# EAGLE schematic ecad-receiver-v5-rx-rev-1 (EAGLE 9.7.0)
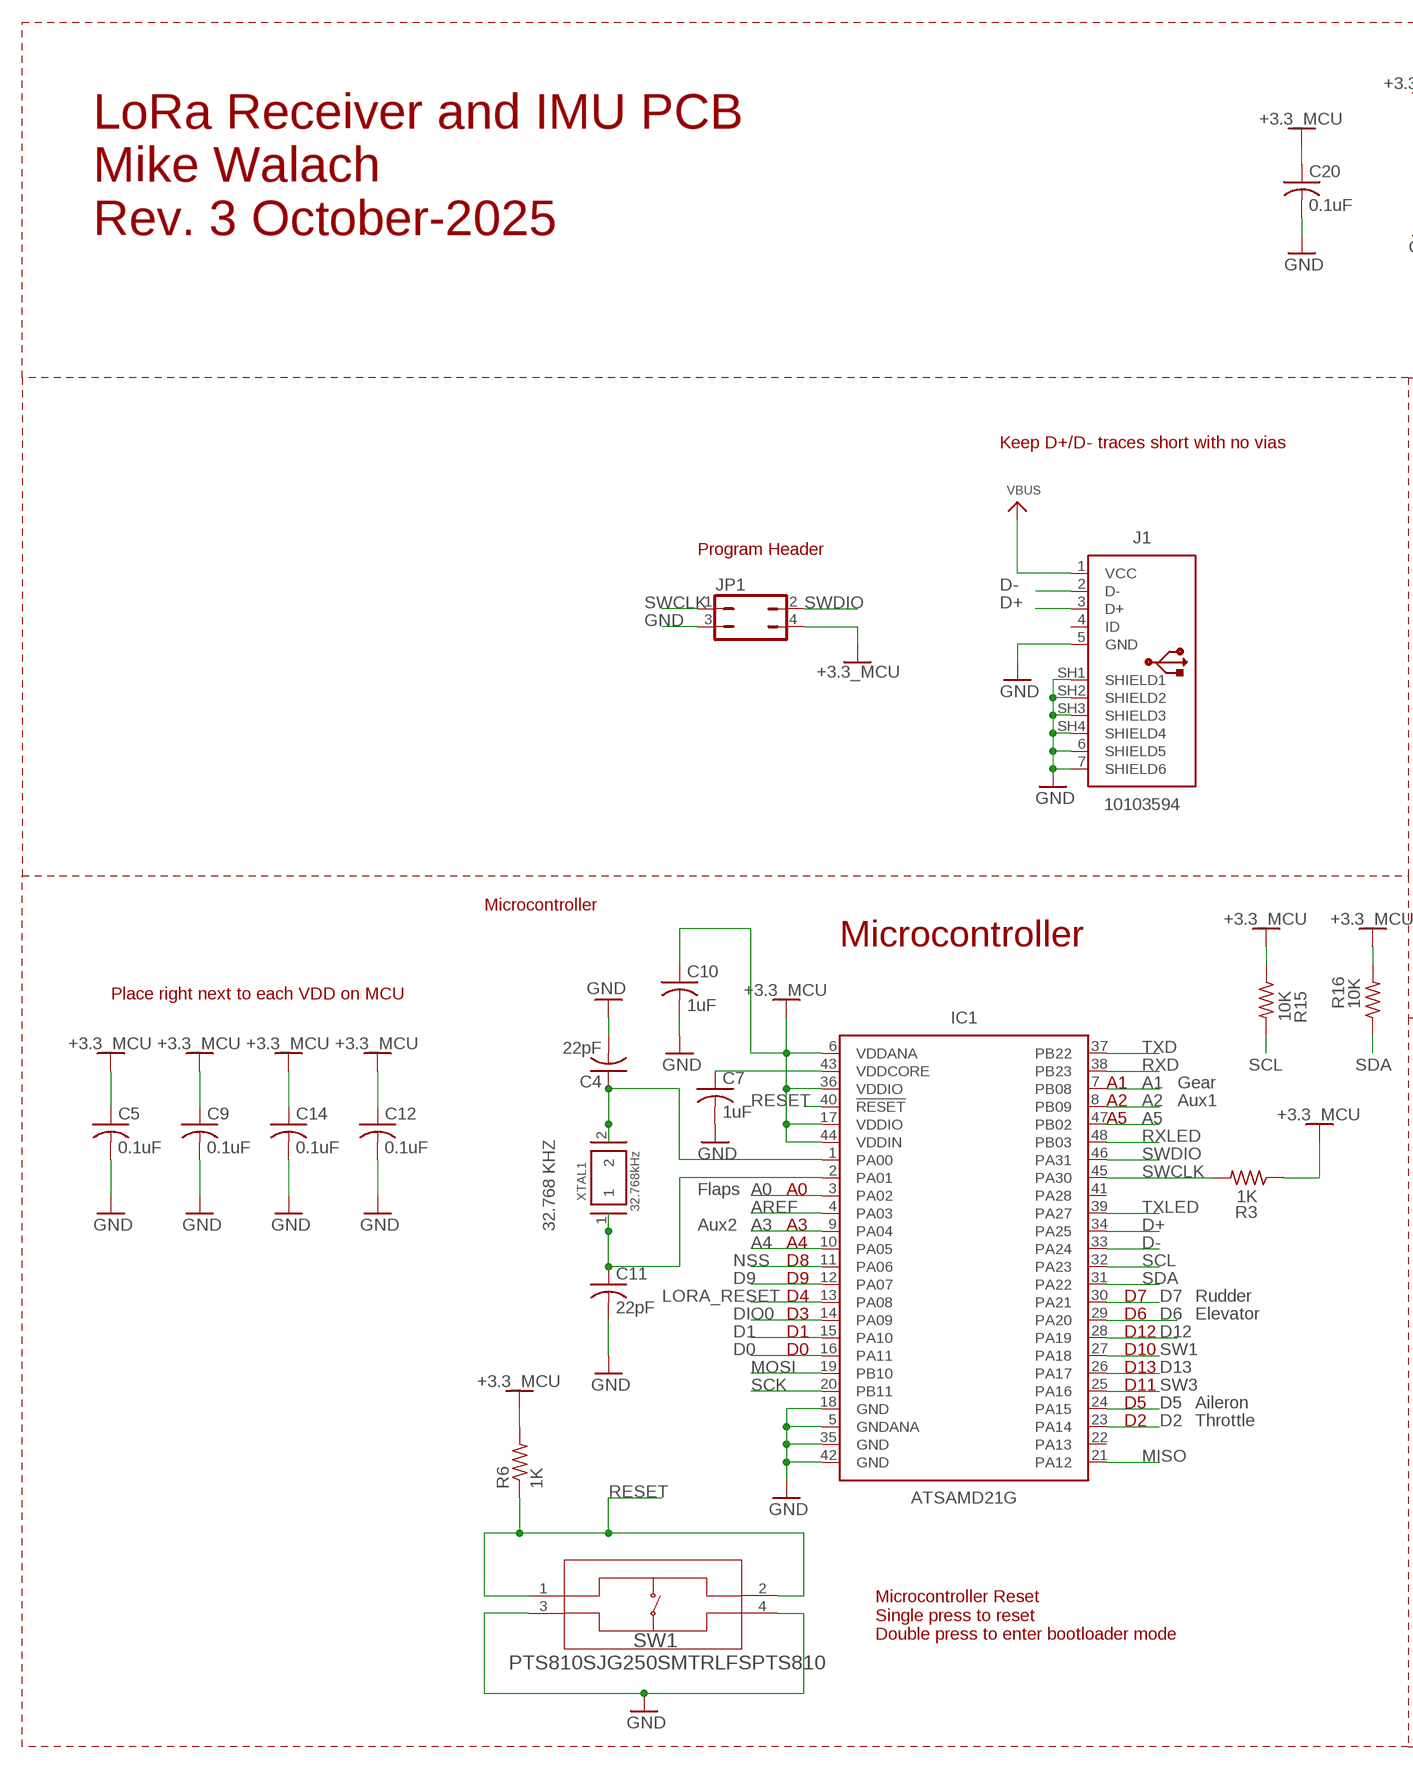
[diagram p0: schematic, sheet 1, part 1 of 2]
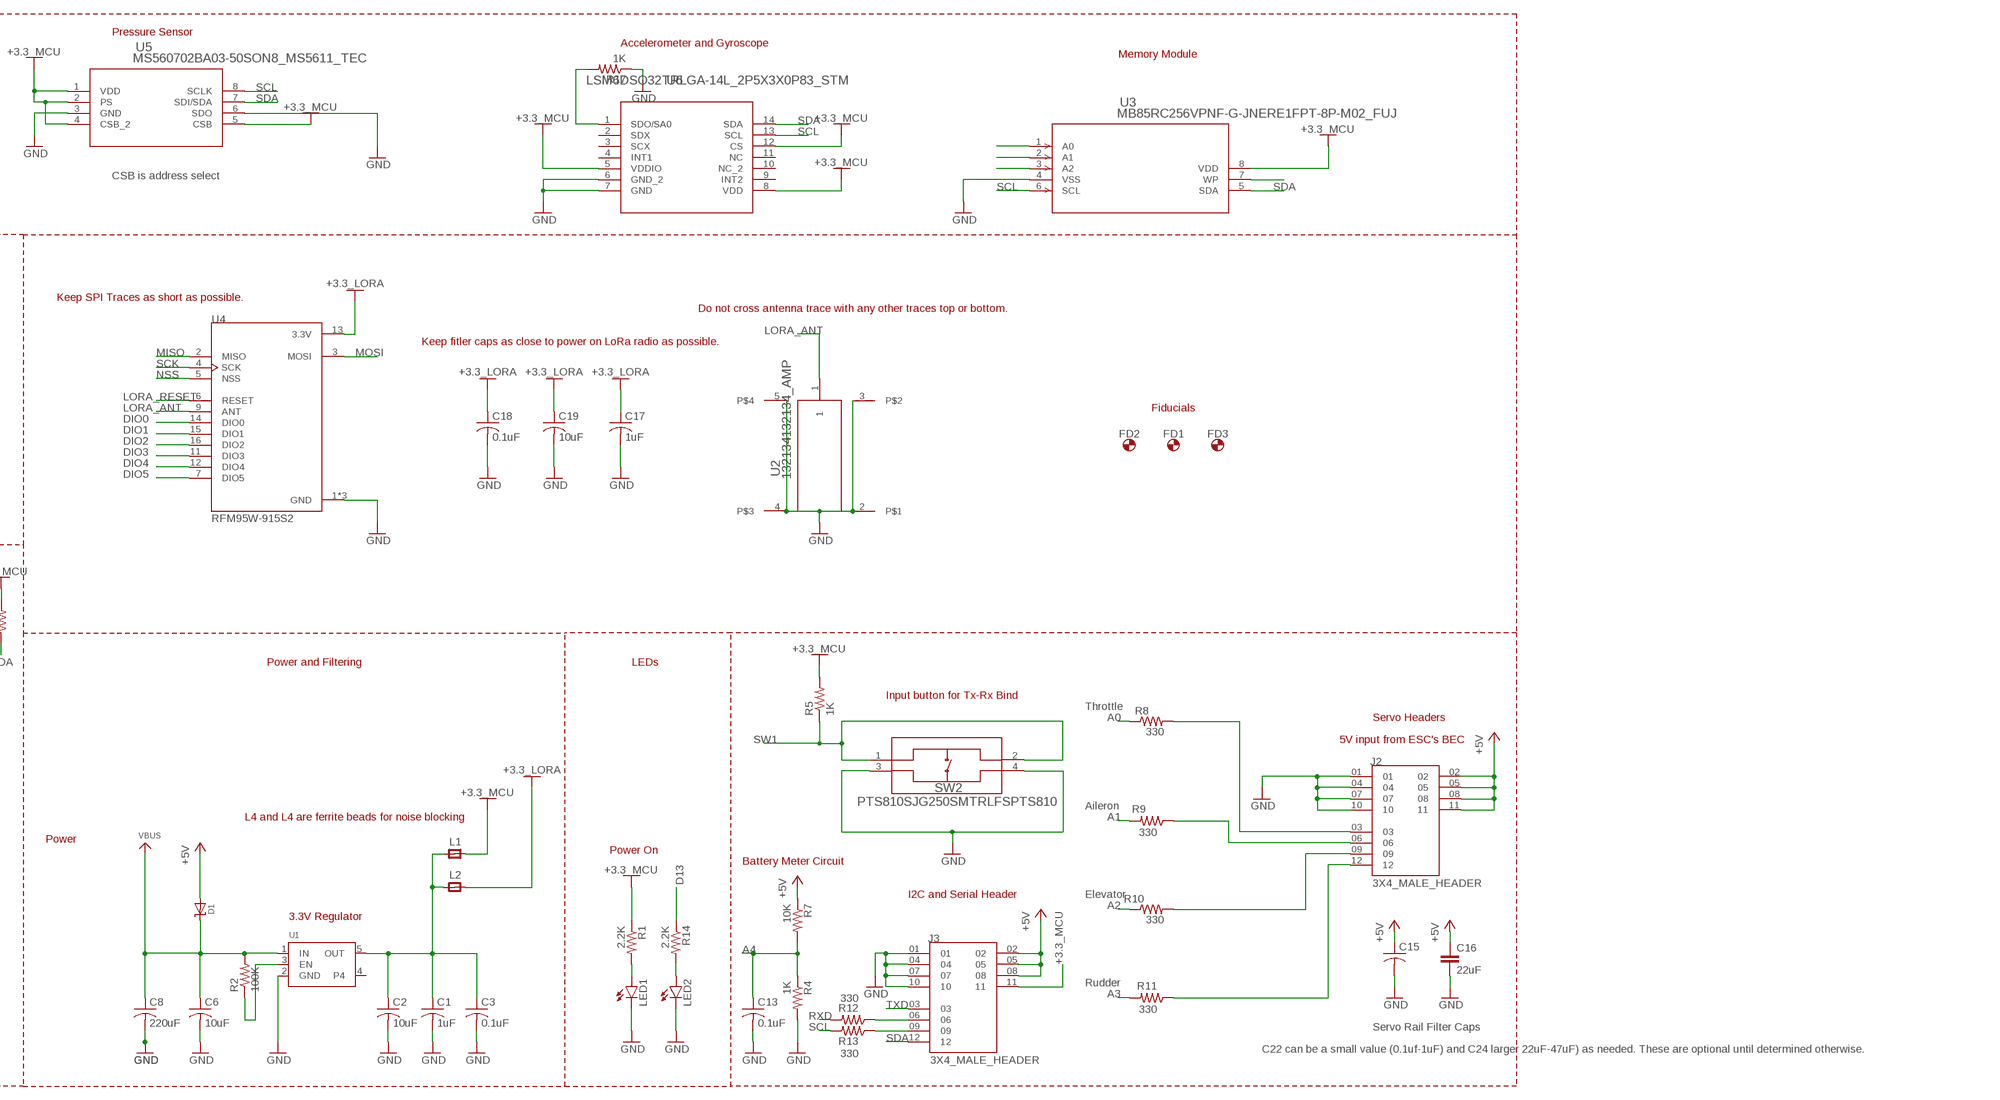
[diagram p1: schematic, sheet 1, part 2 of 2]

## Parts
C1  1uF  C-USC0805  [C0805]
C2  10uF  C-USC0805  [C0805]
C3  0.1uF  C-USC0805  [C0805]
C4  22pF  C-USC0805  [C0805]
C5  0.1uF  C-USC0805  [C0805]
C6  10uF  C-USC0805  [C0805]
C7  1uF  C-USC0805  [C0805]
C8  220uF  C-USC0805  [C0805]
C9  0.1uF  C-USC0805  [C0805]
C10  1uF  C-USC0805  [C0805]
C11  22pF  C-USC0805  [C0805]
C12  0.1uF  C-USC0805  [C0805]
C13  0.1uF  C-USC0805  [C0805]
C14  0.1uF  C-USC0805  [C0805]
C15  100nF  C-USC0805  [C0805]
C16  22uF  22UF-1210-16V-20%  [1210]
C17  1uF  C-USC0805  [C0805]
C18  0.1uF  C-USC0805  [C0805]
C19  10uF  C-USC0805  [C0805]
C20  0.1uF  C-USC0805  [C0805]
D1  MICROBUILDER_DIODE-SCHOTTKYSOD-123  [MICROBUILDER_SOD-123]
FD1  FID_20MIL  [FID_020]
FD2  FID_20MIL  [FID_020]
FD3  FID_20MIL  [FID_020]
IC1  ATSAMD21G  ATSAMD21G_TQFP  [QFP50P900X900X120-48]
J1  10103594  [10103594]
J2  3X4_MALE_HEADER  [TSW-104-07-F-T_SAMTEC_TSW-104-07-F-T]
J3  3X4_MALE_HEADER  [TSW-104-07-F-T_SAMTEC_TSW-104-07-F-T]
JP1  JP2Q  [JP2Q]
L1  RC-MASTER-SMD_FB_0805MP  [RC-MASTER-SMD_L0805MP]
L2  RC-MASTER-SMD_FB_0805MP  [RC-MASTER-SMD_L0805MP]
LED1  LEDSML0805  [SML0805]
LED2  LEDSML0805  [SML0805]
R1  2.2K  R-US_R0805  [R0805]
R2  100K  R-US_R0805  [R0805]
R3  1K  R-US_R0805  [R0805]
R4  1K  R-US_R0805  [R0805]
R5  1K  R-US_R0805  [R0805]
R6  1K  R-US_R0805  [R0805]
R7  10K  R-US_R0805  [R0805]
R8  330  R-US_R0805  [R0805]
R9  330  R-US_R0805  [R0805]
R10  330  R-US_R0805  [R0805]
R11  330  R-US_R0805  [R0805]
R12  330  R-US_R0805  [R0805]
R13  330  R-US_R0805  [R0805]
R14  2.2K  R-US_R0805  [R0805]
R15  10K  R-US_R0805  [R0805]
R16  10K  R-US_R0805  [R0805]
R17  1K  R-US_R0805  [R0805]
SW1  PTS810SJG250SMTRLFSPTS810  [PTS810]
SW2  PTS810SJG250SMTRLFSPTS810  [PTS810]
U1  MICROBUILDER_VREG_SOT23-5  [MICROBUILDER_SOT23-5]
U2  132134132134_AMP  [132134_AMP]
U3  MB85RC256VPNF-G-JNERE1FPT-8P-M02_FUJ  [FPT-8P-M02_FUJ]
U4  RFM95W-915S2  [XCVR_RFM95W-915S2]
U5  MS560702BA03-50SON8_MS5611_TEC  [SON8_MS5611_TEC]
U6  LSM6DSO32TRLGA-14L_2P5X3X0P83_STM  [LGA-14L_2P5X3X0P83_STM]
XTAL1  32.768kHz  ABSO7  [XTAL_ABS07-32.768KHZ-T]

## Nets
+3.3_LORA: C17.1 C18.1 C19.1 L2.2 U4.13(3.3V)
+3.3_MCU: C5.1 C9.1 C10.1 C12.1 C14.1 C20.1 IC1.6(VDDANA) IC1.17(VDDIO) IC1.36(VDDIO) IC1.44(VDDIN) J3.11 JP1.4 L1.2 R1.1 R3.1 R5.2 R6.2 R15.1 R16.2 U3.8(VDD) U5.1(VDD) U5.2(PS) U5.4(CSB_2) U5.5(CSB) U6.5(VDDIO) U6.8(VDD) U6.12(CS)
+5V: C15.1 C16.1 D1.A J2.02 J2.05 J2.08 J2.11 J3.02 J3.05 J3.08 R7.1
A0: IC1.3(PA02) R8.1
A1: IC1.7(PB08) R9.2
A2: IC1.8(PB09) R10.1
A3: IC1.9(PA04) R11.2
A4: C13.1 IC1.10(PA05) R4.1 R7.2
A5: IC1.47(PB02)
AREF: IC1.4(PA03)
D0: IC1.16(PA11)
D1: IC1.15(PA10)
D2: IC1.23(PA14)
D5: IC1.24(PA15)
D6: IC1.29(PA20)
D7: IC1.30(PA21)
D9: IC1.12(PA07)
D12: IC1.28(PA19)
D13: IC1.26(PA17) R14.1
D+: IC1.34(PA25) J1.3(D+)
D-: IC1.33(PA24) J1.2(D-)
DIO0: IC1.14(PA09) U4.14(DIO0)
DIO1: U4.15(DIO1)
DIO2: U4.16(DIO2)
DIO3: U4.11(DIO3)
DIO4: U4.12(DIO4)
DIO5: U4.7(DIO5)
GND: C1.2 C2.2 C3.2 C4.2 C5.2 C6.2 C7.2 C8.2 C9.2 C10.2 C11.2 C12.2 C13.2 C14.2 C15.2 C16.2 C17.2 C18.2 C19.2 C20.2 IC1.5(GNDANA) IC1.18(GND) IC1.35(GND) IC1.42(GND) J1.5(GND) J1.6(SHIELD5) J1.7(SHIELD6) J1.SH1(SHIELD1) J1.SH2(SHIELD2) J1.SH3(SHIELD3) J1.SH4(SHIELD4) J2.01 J2.04 J2.07 J2.10 J3.01 J3.04 J3.07 J3.10 JP1.3 LED1.C LED2.C R4.2 R17.1 SW1.3 SW1.4 SW2.3 SW2.4 U1.2(GND) U2.2 U2.3 U2.4 U2.5 U3.4(VSS) U4.1(GND) U4.8(GND) U4.10(GND) U5.3(GND) U5.6(SDO) U6.6(GND_2) U6.7(GND)
LORA_ANT: U2.1 U4.9(ANT)
LORA_RESET: IC1.13(PA08) U4.6(RESET)
MISO: IC1.21(PA12) U4.2(MISO)
MOSI: IC1.19(PB10) U4.3(MOSI)
N$1: R17.2 U6.1(SDO/SA0)
N$2: C7.1 IC1.43(VDDCORE)
N$3: J3.06 R12.1
N$4: J2.12 R11.1
N$5: R2.1 U1.3(EN)
N$6: J3.09 R13.1
N$7: J2.09 R10.2
N$8: LED2.A R14.2
N$9: U3.7(WP)
N$10: J2.03 R8.2
N$11: U3.3(A2)
N$12: C11.1 IC1.2(PA01) XTAL1.1
N$13: U3.2(A1)
N$14: U3.1(A0)
N$15: C4.1 IC1.1(PA00) XTAL1.2
N$16: J2.06 R9.1
N$30: LED1.A R1.2
NSS: IC1.11(PA06) U4.5(NSS)
OUT: C1.1 C2.1 C3.1 L1.1 L2.1 U1.5(OUT)
RESET: IC1.40(!RESET) R6.1 SW1.1 SW1.2
RXD: IC1.38(PB23) R12.2
RXLED: IC1.48(PB03)
SCK: IC1.20(PB11) U4.4(SCK)
SCL: IC1.32(PA23) R13.2 R15.2 U3.6(SCL) U5.8(SCLK) U6.13(SCL)
SDA: IC1.31(PA22) J3.12 R16.1 U3.5(SDA) U5.7(SDI/SDA) U6.14(SDA)
SW1: IC1.27(PA18) R5.1 SW2.1 SW2.2
SW3: IC1.25(PA16)
SWCLK: IC1.45(PA30) JP1.1 R3.2
SWDIO: IC1.46(PA31) JP1.2
TXD: IC1.37(PB22) J3.03
TXLED: IC1.39(PA27)
VBUS: C6.1 C8.1 D1.C J1.1(VCC) R2.2 U1.1(IN)
Unconnected: IC1.22(PA13) IC1.41(PA28) J1.4(ID) U1.4 U6.2(SDX) U6.3(SCX) U6.4(INT1) U6.9(INT2) U6.10(NC_2) U6.11(NC)

## Notes on the sheet
- Pressure Sensor
- Accelerometer and Gyroscope
- Memory Module
- LoRa Receiver and IMU PCB
  Mike Walach
  Rev. 3 October-2025
- CSB is address select
- Keep D+/D- traces short with no vias
- Keep SPI Traces as short as possible.
- Do not cross antenna trace with any other traces top or bottom.
- Program Header | Keep fitler caps as close to power on LoRa radio as possible.
- Fiducials
- Microcontroller
- Microcontroller
- Place right next to each VDD on MCU
- Power and Filtering | LEDs
- A1 | Gear
- A2 | Aux1
- A5 | Input button for Tx-Rx Bind
- Throttle
- Servo Headers
- Flaps | A0 | 5V input from ESC's BEC
- 32.768 KHZ | Aux2 | A3
- A4
- D8
- D9
- D4 | D7 | Rudder | Aileron
- D3 | D6 | Elevator | L4 and L4 are ferrite beads for noise blocking
- D1 | D12
- D0 | D10 | Power
- D13 | Power On
- D11 | Battery Meter Circuit
- D5 | Aileron
- D2 | Throttle
- I2C and Serial Header | Elevator
- 3.3V Regulator
- Rudder
- Microcontroller Reset
  Single press to reset
  Double press to enter bootloader mode
- Servo Rail Filter Caps
- C22 can be a small value (0.1uf-1uF) and C24 larger 22uF-47uF) as needed. These are optional until determined otherwise.

## Library data of the parts
C1-C15 C17-C20 = rcl:C-US: CAPACITOR, American symbol; SPICEPREFIX: C
C16 = SparkFun-Capacitors:22UF: 22µF ceramic capacitors A capacitor is a passive two-terminal electrical component used to store electrical energy temporarily in an electric field.; PROD_ID: CAP-10381
D1 = flightcomputer-2023:MICROBUILDER_DIODE-SCHOTTKY
FD1-FD3 = fiducial:FID: Fiducial marks. Top and Bottom copper with stop mask; CATEGORY_L1: Fiducial Marks; DESCRIPTION: Fiducial Mark 0.508mm (20mil); PACKAGE: Surface Mount
IC1 = IC_Embedded:ATSAMD21G*: 32-bit ARM-Based Microcontrollers Datasheet <http://ww1.microchip.com/downloads/en/devicedoc/40001884a.pdf> Note:For this part User needs to add thermal via in thermal pad in QFN package while designing a board.; CATEGORY: IC_Embedded; CORE: ARM Cortex M0+; DESCRIPTION: Low-power, high-performance Microchip's ARM® Cortex®-M0+ based flash microcontroller; MANUFACTURER: Microchip Technology; MPN: ATSAMD21G; OPERATING_TEMP: variable; PACKAGE: TQFP-48; PART_STATUS: Active; ROHS_COMPLIANT: COMPLIANT; SERIES: SAM D21G; SUB-CATEGORY: Microcontroller; TYPE: 32 bit Microcontroller
J1 = Connector_USB:10103594: USB(2.0) Micro-B, RCPT, 5POS, SMD-THT-R/A Datasheet <https://cdn.amphenol-icc.com/media/wysiwyg/files/documentation/datasheet/inputoutput/io_usb_micro.pdf> Drawing <https://cdn.amphenol-icc.com/media/wysiwyg/files/drawing/10103594.pdf>; CATEGORY: Connectors; CONTACTS: 5; CURRENT-RATING: 1.8A; DESCRIPTION: CONN RCPT USB2.0 MICRO B SMD R/A; GENDER: Receptacle; MANUFACTURER: Amphenol ICC (FCI); MOUNT_TYPE: R/A; MPN: 10103594-0001LF; OPERATING_TEMPERATURE: -30°C ~ 80°C; PART_STATUS: ACTIVE; ROHS_COMPLIANT: COMPLIANT; SUB_CATEGORY: USB; TYPE: USB-micro B; VOLTAGE-RATING: 100VAC
J2 J3 = BOBCAT_Library:3X4_MALE_HEADER; MANUFACTURER: Samtec; PARTREV: R; STANDARD: Manufacturer Recommendations
JP1 = jumper:JP2Q: JUMPER
L1 L2 = 52101-101-REV-A_v16:RC-MASTER-SMD_FB_: FERRITE BEAD
LED1 LED2 = led:LED: LED OSRAM: - CHIPLED LG R971, LG N971, LY N971, LG Q971, LY Q971, LO R971, LY R971 LH N974, LH R974 LS Q976, LO Q976, LY Q976 LO Q996 - Hyper CHIPLED LW Q18S LB Q993, LB Q99A, LB R99A - SideLED LS A670, LO A670, LY A670, LG A670, LP A670 LB A673, LV A673, LT A673, LW A673 LH A674 LY A675 LS A676, LA A676, LO A676, LY A676, LW A676 LS A679, LY A679, LG A679 - Hyper Micro SIDELED® LS Y876, LA Y876, LO Y876, LY Y876 LT Y87S - SmartLED LW L88C, LW L88S LB L89C, LB L89S, LG L890 LS L89K, LO L89K, LY L89K LS L896, LA L896, LO L896, LY L896 - TOPLED LS T670, LO T670, LY T670, LG T670, LP T670 LSG T670, LSP T670, LSY T670, LOP T670, LYG T670 LG T671, LOG T671, LSG T671 LB T673, LV T673, LT T673, LW T673 LH T674 LS T676, LA T676, LO T676, LY T676, LB T676, LH T676, LSB T676, LW T676 LB T67C, LV T67C, LT T67C, LS T67K, LO T67K, LY T67K, LW E67C LS E67B, LA E67B, LO E67B, LY E67B, LB E67C, LV E67C, LT E67C LW T67C LS T679, LY T679, LG T679 LS T770, LO T770, LY T770, LG T770, LP T770 LB T773, LV T773, LT T773, LW T773 LH T774 LS E675, LA E675, LY E675, LS T675 LS T776, LA T776, LO T776, LY T776, LB T776 LHGB T686 LT T68C, LB T68C - Hyper Mini TOPLED® LB M676 - Mini TOPLED Santana® LG M470 LS M47K, LO M47K, LY M47K Source: http://www.osram.convergy.de LUXEON: - LUMILED® LXK2-PW12-R00, LXK2-PW12-S00, LXK2-PW14-U00, LXK2-PW14-V00 LXK2-PM12-R00, LXK2-PM12-S00, LXK2-PM14-U00 LXK2-PE12-Q00, LXK2-PE12-R00, LXK2-PE12-S00, LXK2-PE14-T00, LXK2-PE14-U00 LXK2-PB12-K00, LXK2-PB12-L00, LXK2-PB12-M00, LXK2-PB14-N00, LXK2-PB14-P00, LXK2-PB14-Q00 LXK2-PR12-L00, LXK2-PR12-M00, LXK2-PR14-Q00, LXK2-PR14-R00 LXK2-PD12-Q00, LXK2-PD12-R00, LXK2-PD12-S00 LXK2-PH12-R00, LXK2-PH12-S00 LXK2-PL12-P00, LXK2-PL12-Q00, LXK2-PL12-R00 Source: www.luxeon.com KINGBRIGHT: KA-3528ASYC Source: www.kingbright.com
R1-R17 = rcl:R-US_: RESISTOR, American symbol; SPICEPREFIX: R
SW1 SW2 = 2024-06-17_17-27-14_Library:PTS810SJG250SMTRLFS; COPYRIGHT: Copyright (C) 2024 Ultra Librarian. All rights reserved.; MANUFACTURER_PART_NUMBER: PTS810SJG250SMTRLFS; MFR_NAME: C&K Components
U1 = flightcomputer-2023:MICROBUILDER_VREG_SOT23-5: SOT23-5 Fixed Voltage Regulators Part Current Out V Out V In V Dropout θJA (°C/W) TJ (°C) Digikey Part No. ADP121 150mA 3.3V 3.4-5.5V 0.09V @ 150mA -- -- ADP121-AUJZ33R7CT-ND ADP121 150mA 3.0V 3.1-5.5V 0.09V @ 150mA -- -- ADP121-AUJZ30R7CT-ND ADP122 300mA 3.3V 3.4-5.5V 0.085V @ 300mA -- -- ADP122AUJZ-3.3-R7CT-ND ADP1712 300mA 3.3V 3.5-5.5V 0.17V @ 300mA -- -- ADP1712AUJZ-3.3-R7TR-ND AP7311 (Low Cost) 150mA 3.3V 3.5-6V 0.15V @ 150mA -- -- AP7311-33WG-7DICT-ND LD39015M18R 150mA 1.8V 1.9V-5.5V 0.08V @ 100mA -- -- 497-6977-1-ND LP2985A-33DBVR 150mA 3.3V 3.3-16V 0.28V @ 150mA 206 150 296-18479-1-ND MCP1824T-3302E/OT 300mA 3.3V 3.5V-6V 0.2V @ 300mA -- -- MCP1824T-3302E/OTCT-ND MIC5205-2.5YM5 TR 150mA 2.5V 2.7-16V 0.165V @ 150mA -- -- 576-1257-2-ND MIC5205-3.0YM5 TR 150mA 3.0V 3.2V-16V 0.165V @ 150mA -- -- 576-1258-2-ND MIC5205-3.3YM5 TR 150mA 3.3V 3.5V-16V 0.165V @ 150mA -- -- 576-1259-2-ND TPS780330220 150mA 3.3V+2.2V 3.6-5.5V 250mV Max -- -- 296-23332-1-ND TDA3663/N1,135 100mA 3.3V 3.5-45V 0.18V @ 50mA -- -- 568-5343-1-ND Max operating temp can be calculated using θJA, TJ (max junction temperature), and power in watts. Set the "Maximum Ambient Temperature" until it reaches TJ ("Max Junction Temperature"), which is the absolute limit for safe use of the regulator: Heat Sink Temperature Calculator <http://www.daycounter.com/Calculators/Heat-Sink-Temperature-Calculator.phtml> For example, With 12V source into a 3.3V LP2985 and a 30mA load, we are dissipating (12V-3.3V) * 0.03A = 0.261W. With a θJA of 206 °C/W, a TJ of 150°C, and 261mW we can safely use the chip without a heat sink up to 75°C (=147.1°C Junction Temperature).
U2 = 2025-03-19_02-22-58_Library:132134; COPYRIGHT: Copyright (C) 2025 Ultra Librarian. All rights reserved.; MANUFACTURER_PART_NUMBER: 132134; MFR_NAME: Amphenol ICC
U3 = 2025-09-02_13-41-18_Library:MB85RC256VPNF-G-JNERE1; COPYRIGHT: Copyright (C) 2025 Ultra Librarian. All rights reserved.; MANUFACTURER_NAME: Fujitsu Semiconductor; MANUFACTURER_PART_NUMBER: MB85RC256VPNF-G-JNERE1
U4 = RFM95W-915S2:RFM95W-915S2: Check availability <https://pricing.snapeda.com/parts/RFM95W-915S2/RF%20Solutions/view-part?ref=eda>; AVAILABILITY: In Stock; CHECK_PRICES: https://www.snapeda.com/parts/RFM95W-915S2/RF/view-part/?ref=eda; DESCRIPTION: 802.15.4 LoRa™ Transceiver Module 915MHz Antenna Not Included Surface Mount; MF: RF Solutions; MP: RFM95W-915S2; PACKAGE: Non Standard RF Solutions; PRICE: None; PURCHASE-URL: https://www.snapeda.com/api/url_track_click_mouser/?unipart_id=585488&manufacturer=RF Solutions&part_name=RFM95W-915S2&search_term=None; SNAPEDA_LINK: https://www.snapeda.com/parts/RFM95W-915S2/RF/view-part/?ref=snap
U5 = 2025-03-19_19-02-07_Library:MS560702BA03-50; COPYRIGHT: Copyright (C) 2025 Ultra Librarian. All rights reserved.; MANUFACTURER_PART_NUMBER: MS560702BA03-50; MFR_NAME: TE Connectivity
U6 = LSM6DSO32TR_extendedpads_fixed_v2:LSM6DSO32TR; COPYRIGHT: Copyright (C) 2026 Ultra Librarian. All rights reserved.; DATASHEET: https://www.st.com/resource/en/datasheet/lsm6dso32.pdf; DESCRIPTION: 6-axis IMU (inertial measurement unit): 3-axis accelerometer and 3-axis gyroscope; MANUFACTURER_NAME: STMicroelectronics; MANUFACTURER_PART_NUMBER: LSM6DSO32TR
XTAL1 = Crystal-WA:ABSO7: CRYSTAL 32.7680KHZ 12.5PF SMD Datasheet <https://abracon.com/Resonators/ABS07.pdf>; CATEGORY: Crystal; MANUFACTURER: Abracon LLC; MPN: ABS07-32.768KHZ-T; OPERATING_TEMPERATURE: -40°C ~ 85°C; PART_STATUS: ACTIVE; ROHS_COMPLIANT: COMPLIANT; SERIES: ABS07; SUB_CATEGORY: Crystal Surface Mount; TYPE: Crystal